# EAGLE design team back ECU (EAGLE 9.6.2)
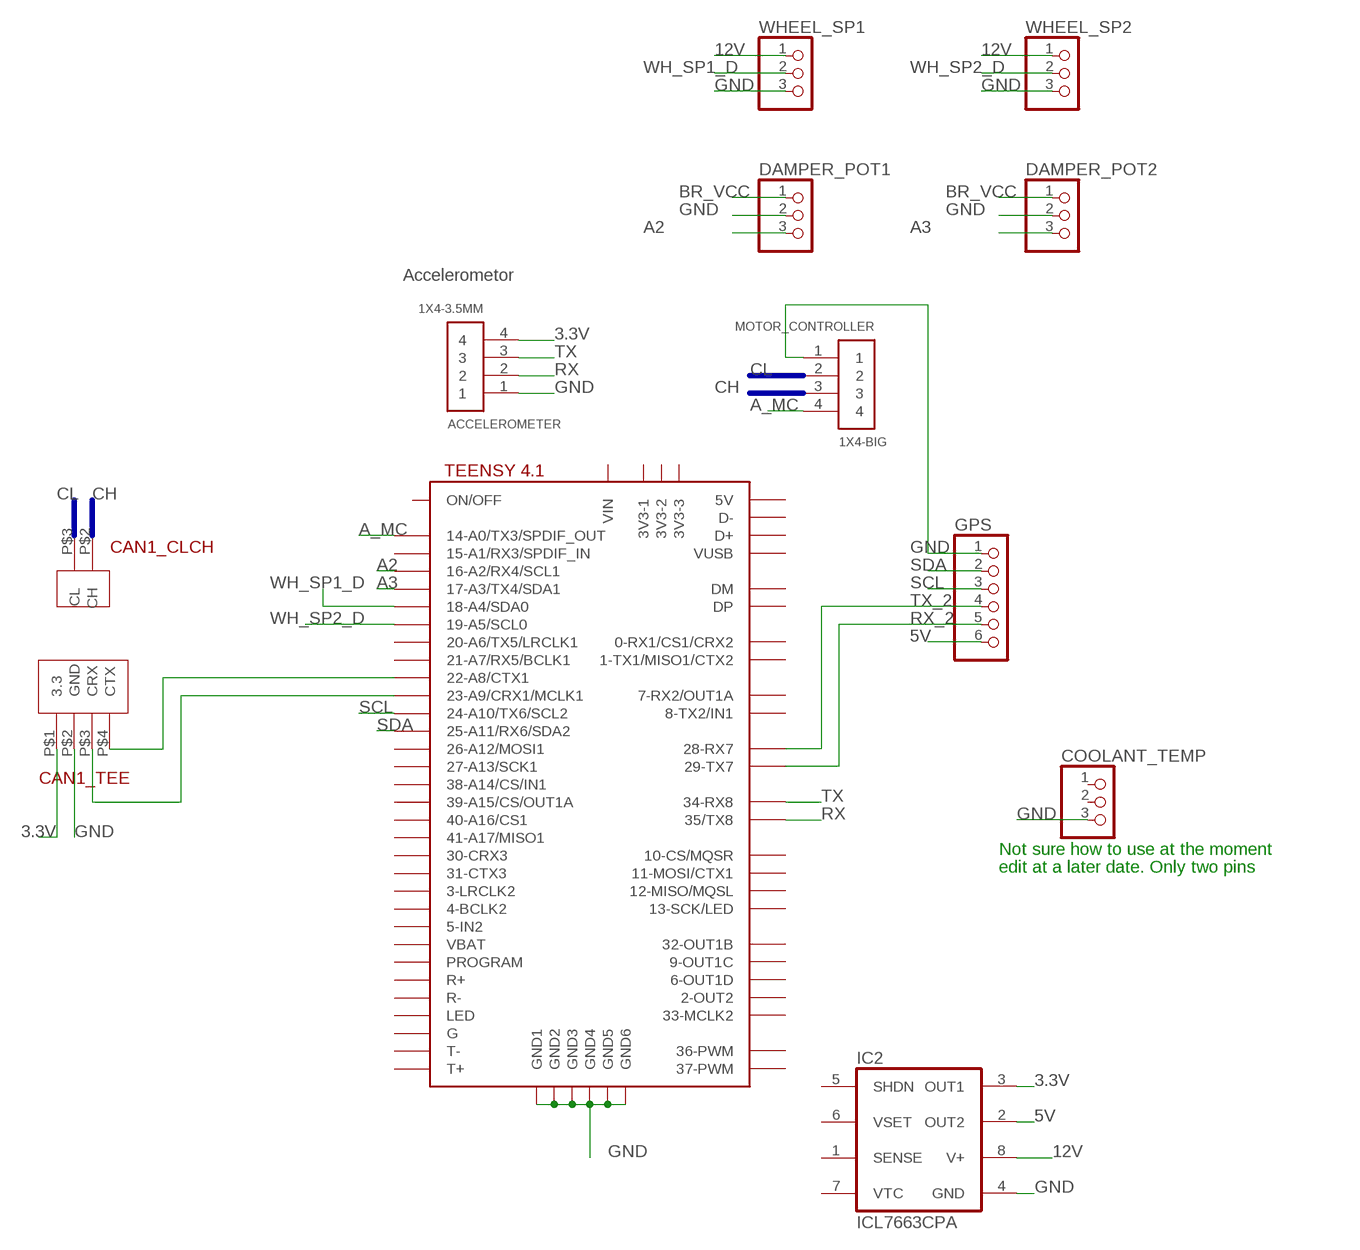
[diagram p0: schematic, sheet 1]

## Parts
ACCELEROMETER  1X4-3.5MM  [1X04-3.5MM]
CAN1_CLCH  CAN_BUS  [CAN_BUS]
CAN1_TEE  CAN_TEE  [CAN_TEN]
COOLANT_TEMP  PINHD-1X3  [1X03]
DAMPER_POT1  PINHD-1X3CB  [1X03-CLEANBIG]
DAMPER_POT2  PINHD-1X3CB  [1X03-CLEANBIG]
GPS  PINHD-1X6-3.5MM  [1X06-3.5MM]
IC2  ICL7663CPA  [DIL08]
MOTOR_CONTROLLER  1X4-BIG  [1X04-BIG]
U$1  TEENSY41  [TEENSY41]
WHEEL_SP1  PINHD-1X3  [1X03]
WHEEL_SP2  PINHD-1X3  [1X03]

## Nets
3.3V: ACCELEROMETER.4 CAN1_TEE.P$1(3.3) IC2.3(OUT1)
5V: GPS.6 IC2.2(OUT2)
12V: IC2.8(V+) WHEEL_SP1.1 WHEEL_SP2.1
A2: DAMPER_POT1.3 U$1.16-A2/RX4/SCL1
A3: DAMPER_POT2.3 U$1.17-A3/TX4/SDA1
A_MC: MOTOR_CONTROLLER.4 U$1.14-A0/TX3/SPDIF_OUT
BR_VCC: DAMPER_POT1.1 DAMPER_POT2.1
GND: ACCELEROMETER.1 CAN1_TEE.P$2(GND) COOLANT_TEMP.3 DAMPER_POT1.2 DAMPER_POT2.2 GPS.1 IC2.4(GND) MOTOR_CONTROLLER.1 U$1.GND1 U$1.GND2 U$1.GND3 U$1.GND4 U$1.GND5 U$1.GND6 WHEEL_SP1.3 WHEEL_SP2.3
N$2: CAN1_TEE.P$3(CRX) U$1.23-A9/CRX1/MCLK1
N$3: CAN1_TEE.P$4(CTX) U$1.22-A8/CTX1
RX: ACCELEROMETER.2 U$1.35-TX8(35/TX8)
RX_2: GPS.5 U$1.29-TX7
SCL: GPS.3 U$1.24-A10/TX6/SCL2
SDA: GPS.2 U$1.25-A11/RX6/SDA2
TX: ACCELEROMETER.3 U$1.34-RX8
TX_2: GPS.4 U$1.28-RX7
WH_SP1_D: U$1.18-A4/SDA0 WHEEL_SP1.2
WH_SP2_D: U$1.19-A5/SCL0 WHEEL_SP2.2
Unconnected: CAN1_CLCH.P$2(CH) CAN1_CLCH.P$3(CL) COOLANT_TEMP.1 COOLANT_TEMP.2 IC2.1(SENSE) IC2.5(SHDN) IC2.6(VSET) IC2.7(VTC) MOTOR_CONTROLLER.2 MOTOR_CONTROLLER.3 U$1.0-RX1/CS1/CRX2 U$1.1-TX1/MISO1/CTX2 U$1.2-OUT2 U$1.3-LRCLK2 U$1.3V3-1 U$1.3V3-2 U$1.3V3-3 U$1.4-BCLK2 U$1.5-IN2 U$1.6-OUT1D U$1.7-RX2/OUT1A U$1.8-TX2/IN2(8-TX2/IN1) U$1.9-OUT1C U$1.10-CS\MQSR(10-CS/MQSR) U$1.11-MOSI/CTX1 U$1.12-MISO/MQSL U$1.13-SCK/LED U$1.15-A1/RX3/SPDIF_IN U$1.20-A6/TX5/LRCLK1 U$1.21-A7/RX5/BCLK1 U$1.26-A12/MOSI1 U$1.27-A13/SCK1 U$1.30-CRX3 U$1.31-CTX3 U$1.32-OUT1B U$1.33-MCLK2 U$1.36-PWM U$1.37-PWM U$1.38-A14/CS/IN1 U$1.39-A15/CS/OUT1A U$1.40-A16/CS1 U$1.41-A17/MISO1 U$1.+5V(5V) U$1.D+ U$1.D- U$1.DM U$1.DP U$1.G U$1.LED U$1.ON/OFF U$1.PROGRAM U$1.R+ U$1.R- U$1.T+ U$1.T- U$1.VBAT U$1.VIN U$1.VUSB

## Buses
CL
CH

## Notes on the sheet
- Not sure how to use at the moment
- edit at a later date. Only two pins

## Library data of the parts
ACCELEROMETER = adafruit:1X4: 4-pin connector; AC: Accelerometor
CAN1_CLCH = F-E library custom components:CAN_BUS
CAN1_TEE = F-E library custom components:CAN_TEE
COOLANT_TEMP DAMPER_POT1 DAMPER_POT2 WHEEL_SP1 WHEEL_SP2 = adafruit:PINHD-1X3: PIN HEADER
GPS = adafruit:PINHD-1X6: PIN HEADER
IC2 = maxim:ICL7663CPA: Positive VOLTAGE REGULATOR; OC_FARNELL: unknown; OC_NEWARK: unknown
MOTOR_CONTROLLER = adafruit:1X4: 4-pin connector
U$1 = teensy:TEENSY41

## Board
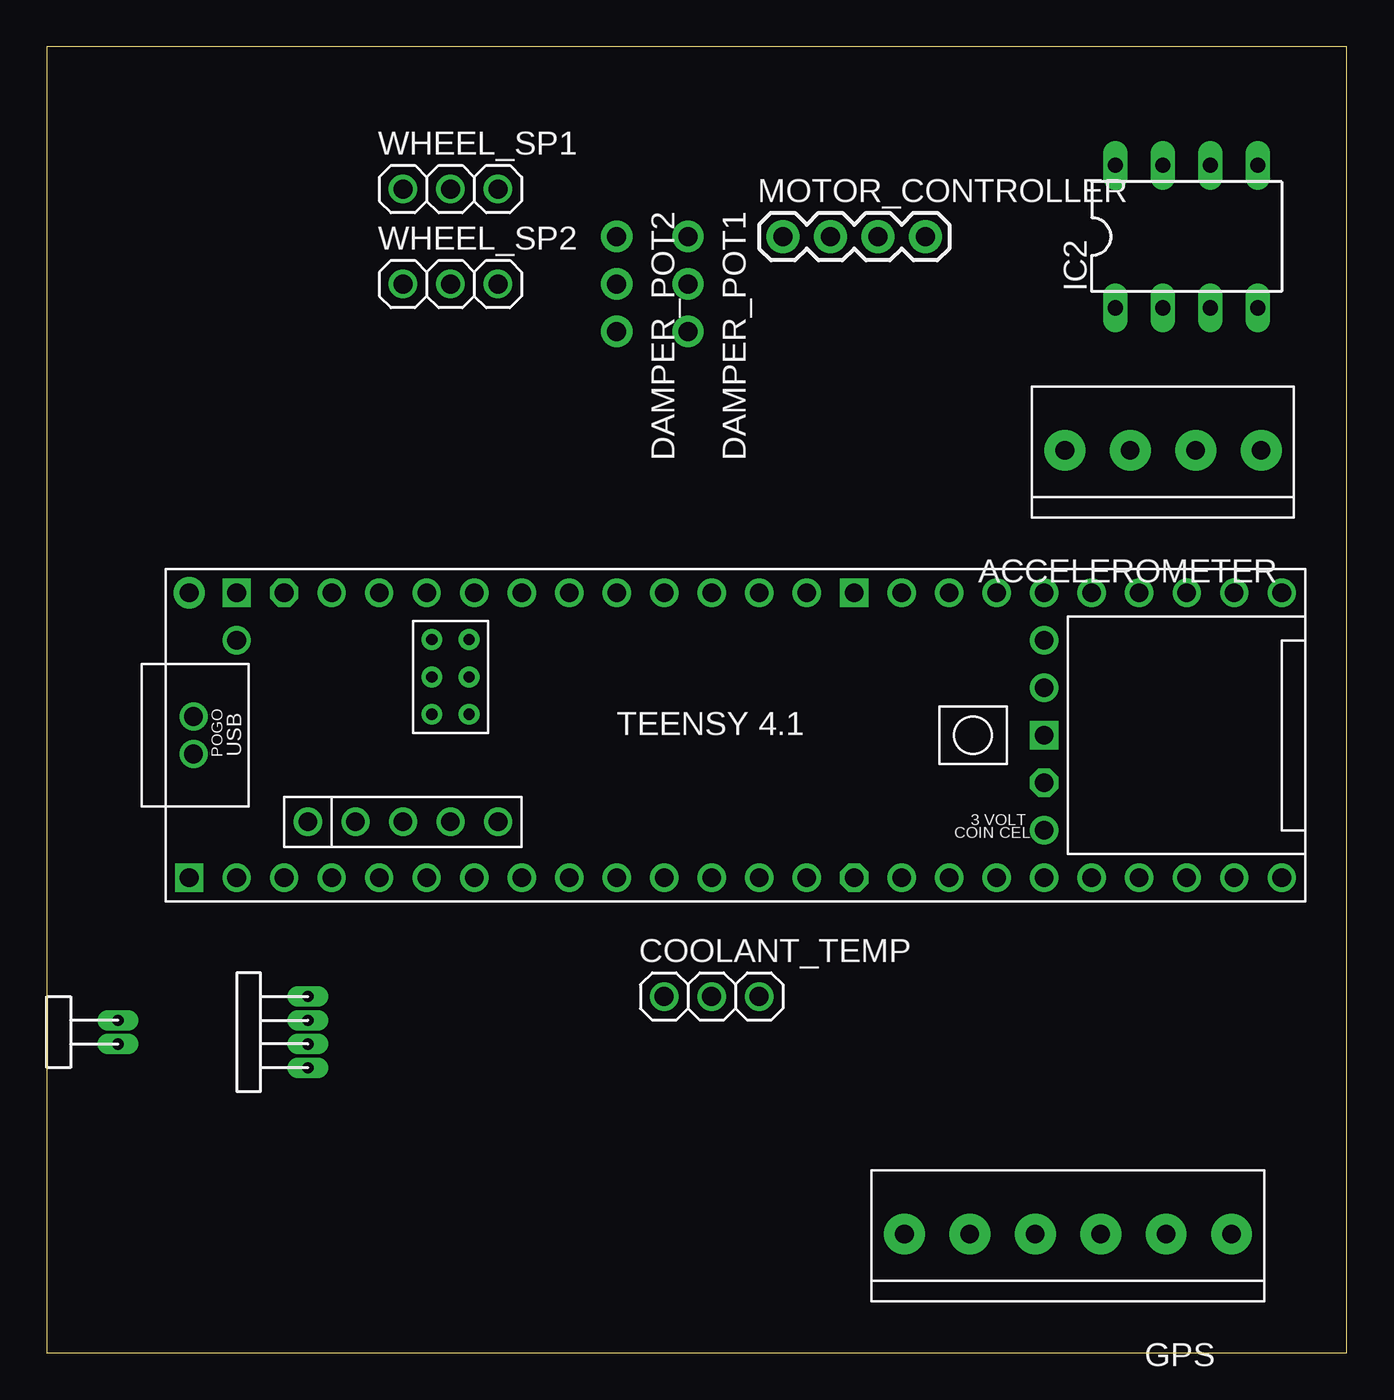
[diagram p1: board, top side]
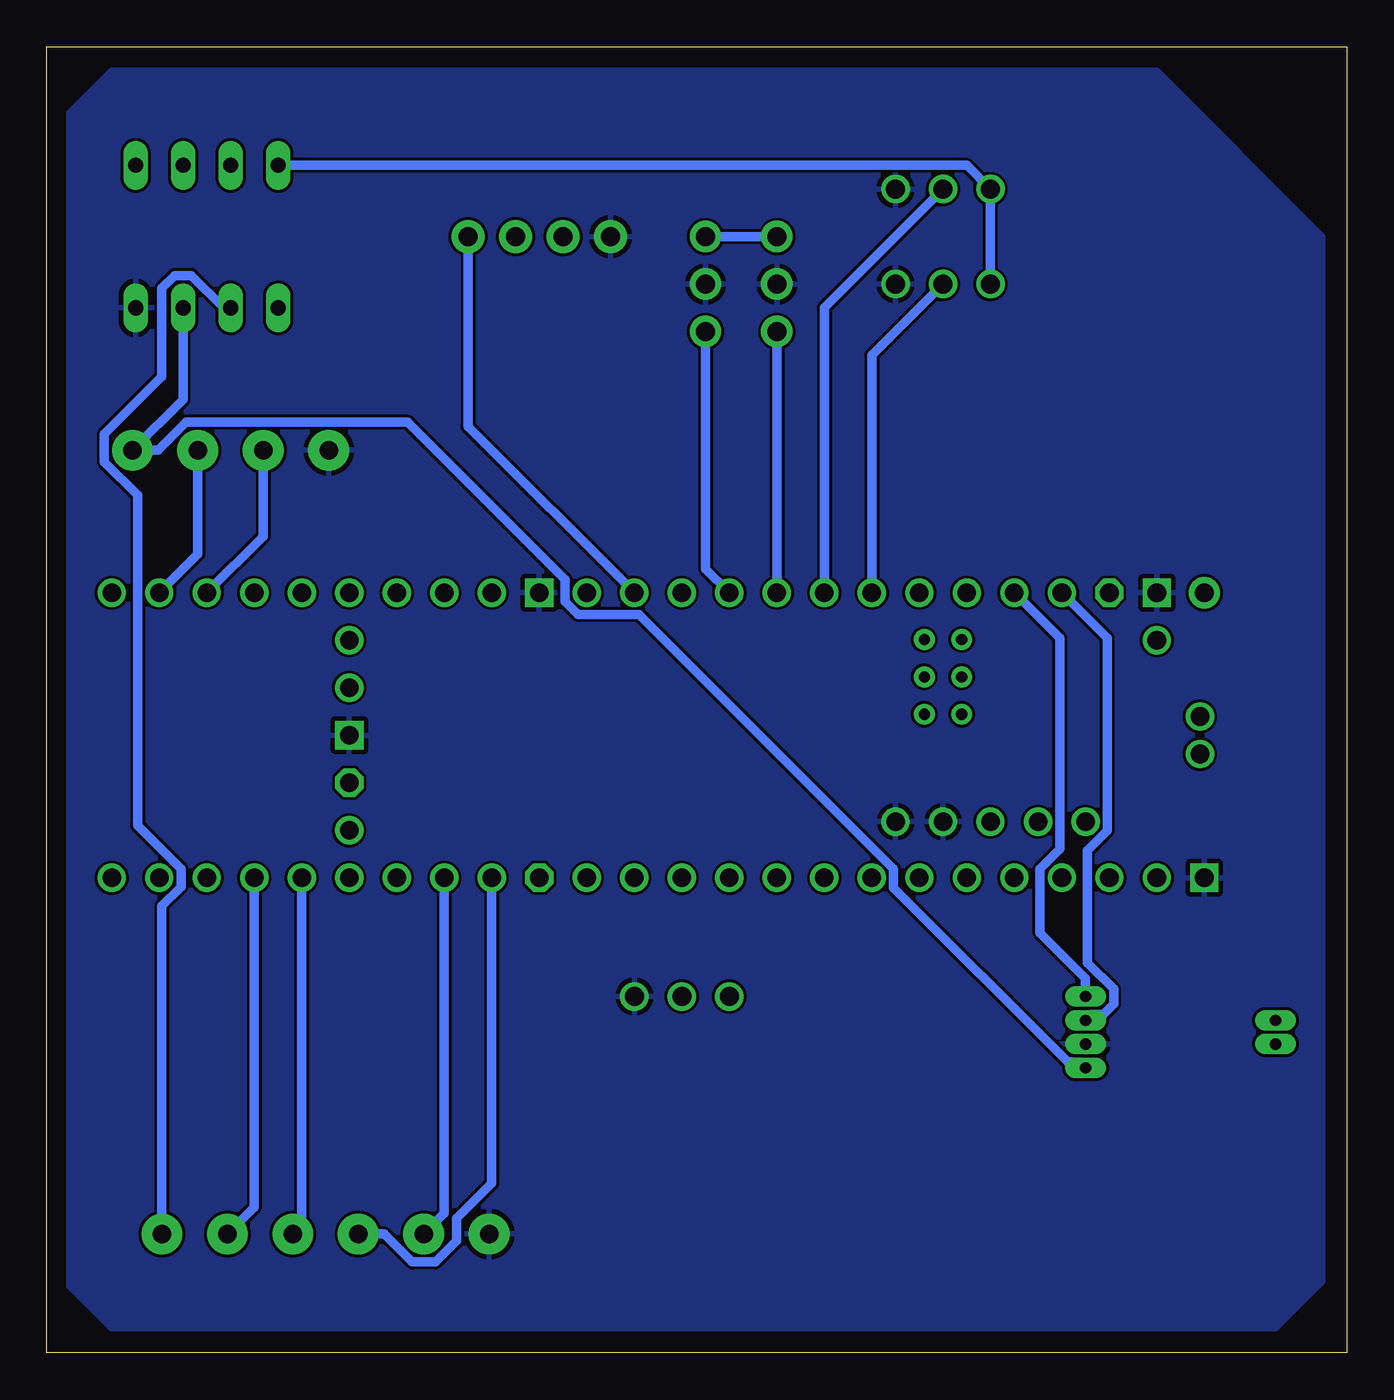
[diagram p2: board, bottom side, seen from below]

Size 69.52 x 69.84 mm. Coordinates in mm from the lower left corner, seen from the top.
Outline: 0,0 69.52,0 69.52,69.84 0,69.84 0,0
Copper layers (1*16): Top 0.035mm / dielectric 1.5mm / Bottom 0.035mm
Design rules "default": minimum track width 6mil, minimum drill 0.35mm, track to track 6mil, track to pad 6mil, pad to pad 6mil, via to via 6mil, smd to smd 6mil, copper to edge 40mil, drill to drill 6mil, minimum pad ring 10mil, minimum via ring 8mil, stop-mask expansion 4mil, vias tented up to drill 0mil, thermal gap 10mil

### Footprints (pad centres in the part's own frame; a part is rotated, then mirrored left to right if it is on the bottom)
1X04-3.5MM = drill 1 pad 2.184: 1 -5.25,0; 2 -1.75,0; 3 1.75,0; 4 5.25,0
CAN_BUS = drill 0.6 long: P$2 3.81,2.54; P$3 5.08,2.54
CAN_TEN = drill 0.6 long: P$1 2.54,1.27; P$2 3.81,1.27; P$3 5.08,1.27; P$4 6.35,1.27
1X03 = drill 1.016: 1 -2.54,0; 2 0,0; 3 2.54,0
1X03-CLEANBIG = drill 1.016 pad 1.676: 1 -2.54,0; 2 0,0; 3 2.54,0
1X06-3.5MM = drill 1 pad 2.184: 1 -8.75,0; 2 -5.25,0; 3 -1.75,0; 4 1.75,0; 5 5.25,0; 6 8.75,0
DIL08 = drill 0.813 long: 1 -3.81,-3.81; 2 -1.27,-3.81; 3 1.27,-3.81; 4 3.81,-3.81; 5 3.81,3.81; 6 1.27,3.81; 7 -1.27,3.81; 8 -3.81,3.81
1X04-BIG = drill 1.016 pad 1.778: 1 0,0; 2 2.54,0; 3 5.08,0; 4 7.62,0
TEENSY41 = drill 1: 0-RX1/CS1/CRX2 -27.94,-7.62; 1-TX1/MISO1/CTX2 -25.4,-7.62; 2-OUT2 -22.86,-7.62; 3-LRCLK2 -20.32,-7.62; 4-BCLK2 -17.78,-7.62; 5-IN2 -15.24,-7.62; 6-OUT1D -12.7,-7.62; 7-RX2/OUT1A -10.16,-7.62; 8-TX2/IN2 -7.62,-7.62; 9-OUT1C -5.08,-7.62; 10-CS\MQSR -2.54,-7.62; 11-MOSI/CTX1 0,-7.62; 12-MISO/MQSL 2.54,-7.62; 13-SCK/LED 2.54,7.62; 14-A0/TX3/SPDIF_OUT 0,7.62; 15-A1/RX3/SPDIF_IN -2.54,7.62; 16-A2/RX4/SCL1 -5.08,7.62; 17-A3/TX4/SDA1 -7.62,7.62; 18-A4/SDA0 -10.16,7.62; 19-A5/SCL0 -12.7,7.62; 20-A6/TX5/LRCLK1 -15.24,7.62; 21-A7/RX5/BCLK1 -17.78,7.62; 22-A8/CTX1 -20.32,7.62; 23-A9/CRX1/MCLK1 -22.86,7.62; 24-A10/TX6/SCL2 7.62,-7.62; 25-A11/RX6/SDA2 10.16,-7.62; 26-A12/MOSI1 12.7,-7.62; 27-A13/SCK1 15.24,-7.62; 28-RX7 17.78,-7.62; 29-TX7 20.32,-7.62; 30-CRX3 22.86,-7.62; 31-CTX3 25.4,-7.62; 32-OUT1B 27.94,-7.62; 33-MCLK2 27.94,7.62; 34-RX8 25.4,7.62; 35-TX8 22.86,7.62; 36-PWM 20.32,7.62; 37-PWM 17.78,7.62; 38-A14/CS/IN1 15.24,7.62; 39-A15/CS/OUT1A 12.7,7.62; 40-A16/CS1 10.16,7.62; 41-A17/MISO1 7.62,7.62; +5V -24.13,-4.62; D+ -30.25,-1; D- -30.25,1; DM -21.59,-4.62; DP -19.05,-4.62; GND4 -16.51,-4.62; GND5 -13.97,-4.62; ON/OFF 15.24,5.08; PROGRAM 15.24,2.54; VBAT 15.24,-5.08; VUSB -27.94,5.08 | drill 1 octagon: 3V3-1 5.08,-7.62; 3V3-2 15.24,-2.54; 3V3-3 -25.4,7.62 | drill 0.6: G -15.51,3.12; LED -17.51,3.12; R+ -17.51,5.12; R- -15.51,5.12; T+ -15.51,1.12; T- -17.51,1.12 | drill 1 square: GND1 -30.48,-7.62; GND2 15.24,0; GND3 5.08,7.62; GND6 -27.94,7.62 | drill 1 pad 1.676: VIN -30.48,7.62

### Placement (x,y rotation side)
ACCELEROMETER  59.69,48.26 0 top
CAN1_CLCH  6.35,12.7 90 top
CAN1_TEE  15.24,12.7 90 top
COOLANT_TEMP  35.56,19.05 0 top
DAMPER_POT1  34.29,57.15 270 top
DAMPER_POT2  30.48,57.15 270 top
GPS  54.61,6.35 0 top
IC2  60.96,59.69 0 top
MOTOR_CONTROLLER  39.37,59.69 0 top
U$1  38.1,33.02 0 top
WHEEL_SP1  21.59,62.23 0 top
WHEEL_SP2  21.59,57.15 0 top

### Tracks (layer width: path | path; a pad name or v marks a point on that pad's centre or on a via)
3.3V
  Bottom 0.508: IC2.3 62.23,50.97 ACCELEROMETER.4 63.56,48.26 62.06,49.76 50.22,49.76 41.8,41.34 41.8,40.16 41.12,39.48 37.84,39.48 24.24,25.88 24.24,24.87 14.92,15.55 14.28,15.55 CAN1_TEE.P$1
5V
  Bottom 0.508: GPS.6 63.36,23.9 62.34,24.92 62.34,25.88 64.66,28.2 64.66,45.86 66.44,47.64 66.44,49.13 63.36,52.21 63.36,56.92 62.67,57.61 61.79,57.61 60.06,55.88 IC2.2
12V
  Bottom 0.508: WHEEL_SP2.1 WHEEL_SP1.1 20.32,63.5 IC2.8
A2
  Bottom 0.508: DAMPER_POT1.3 34.29,41.91 U$1.16-A2/RX4/SCL1
A3
  Bottom 0.508: DAMPER_POT2.3 U$1.17-A3/TX4/SDA1
A_MC
  Bottom 0.508: MOTOR_CONTROLLER.4 46.99,49.53 U$1.14-A0/TX3/SPDIF_OUT
BR_VCC
  Bottom 0.508: DAMPER_POT2.1 DAMPER_POT1.1
GND
  pour Bottom: 1.27,3.81 3.81,1.27 66.04,1.27 68.58,3.81 68.58,66.04 66.04,68.58 10.16,68.58 1.27,59.69
N$2
  Bottom 0.508: CAN1_TEE.P$3 13.66,18.09 13.02,18.09 12.46,18.65 12.46,19.45 13.86,20.85 13.86,26.87 12.81,27.92 12.81,38.21 U$1.23-A9/CRX1/MCLK1
N$3
  Bottom 0.508: CAN1_TEE.P$4 13.97,20.03 16.4,22.46 16.4,25.88 15.35,26.93 15.35,38.21 U$1.22-A8/CTX1
RX
  Bottom 0.508: ACCELEROMETER.2 57.94,43.66 U$1.35-TX8
RX_2
  Bottom 0.508: U$1.29-TX7 58.42,7.79 GPS.5
SCL
  Bottom 0.508: U$1.24-A10/TX6/SCL2 45.72,9.06 47.6,7.18 47.6,5.99 48.74,4.85 49.98,4.85 51.48,6.35 GPS.3
SDA
  Bottom 0.508: U$1.25-A11/RX6/SDA2 48.26,7.45 GPS.2
TX
  Bottom 0.508: ACCELEROMETER.3 61.44,42.7 U$1.34-RX8
TX_2
  Bottom 0.508: U$1.28-RX7 55.88,6.83 GPS.4
WH_SP1_D
  Bottom 0.508: WHEEL_SP1.2 27.94,55.88 U$1.18-A4/SDA0
WH_SP2_D
  Bottom 0.508: WHEEL_SP2.2 25.4,53.34 U$1.19-A5/SCL0